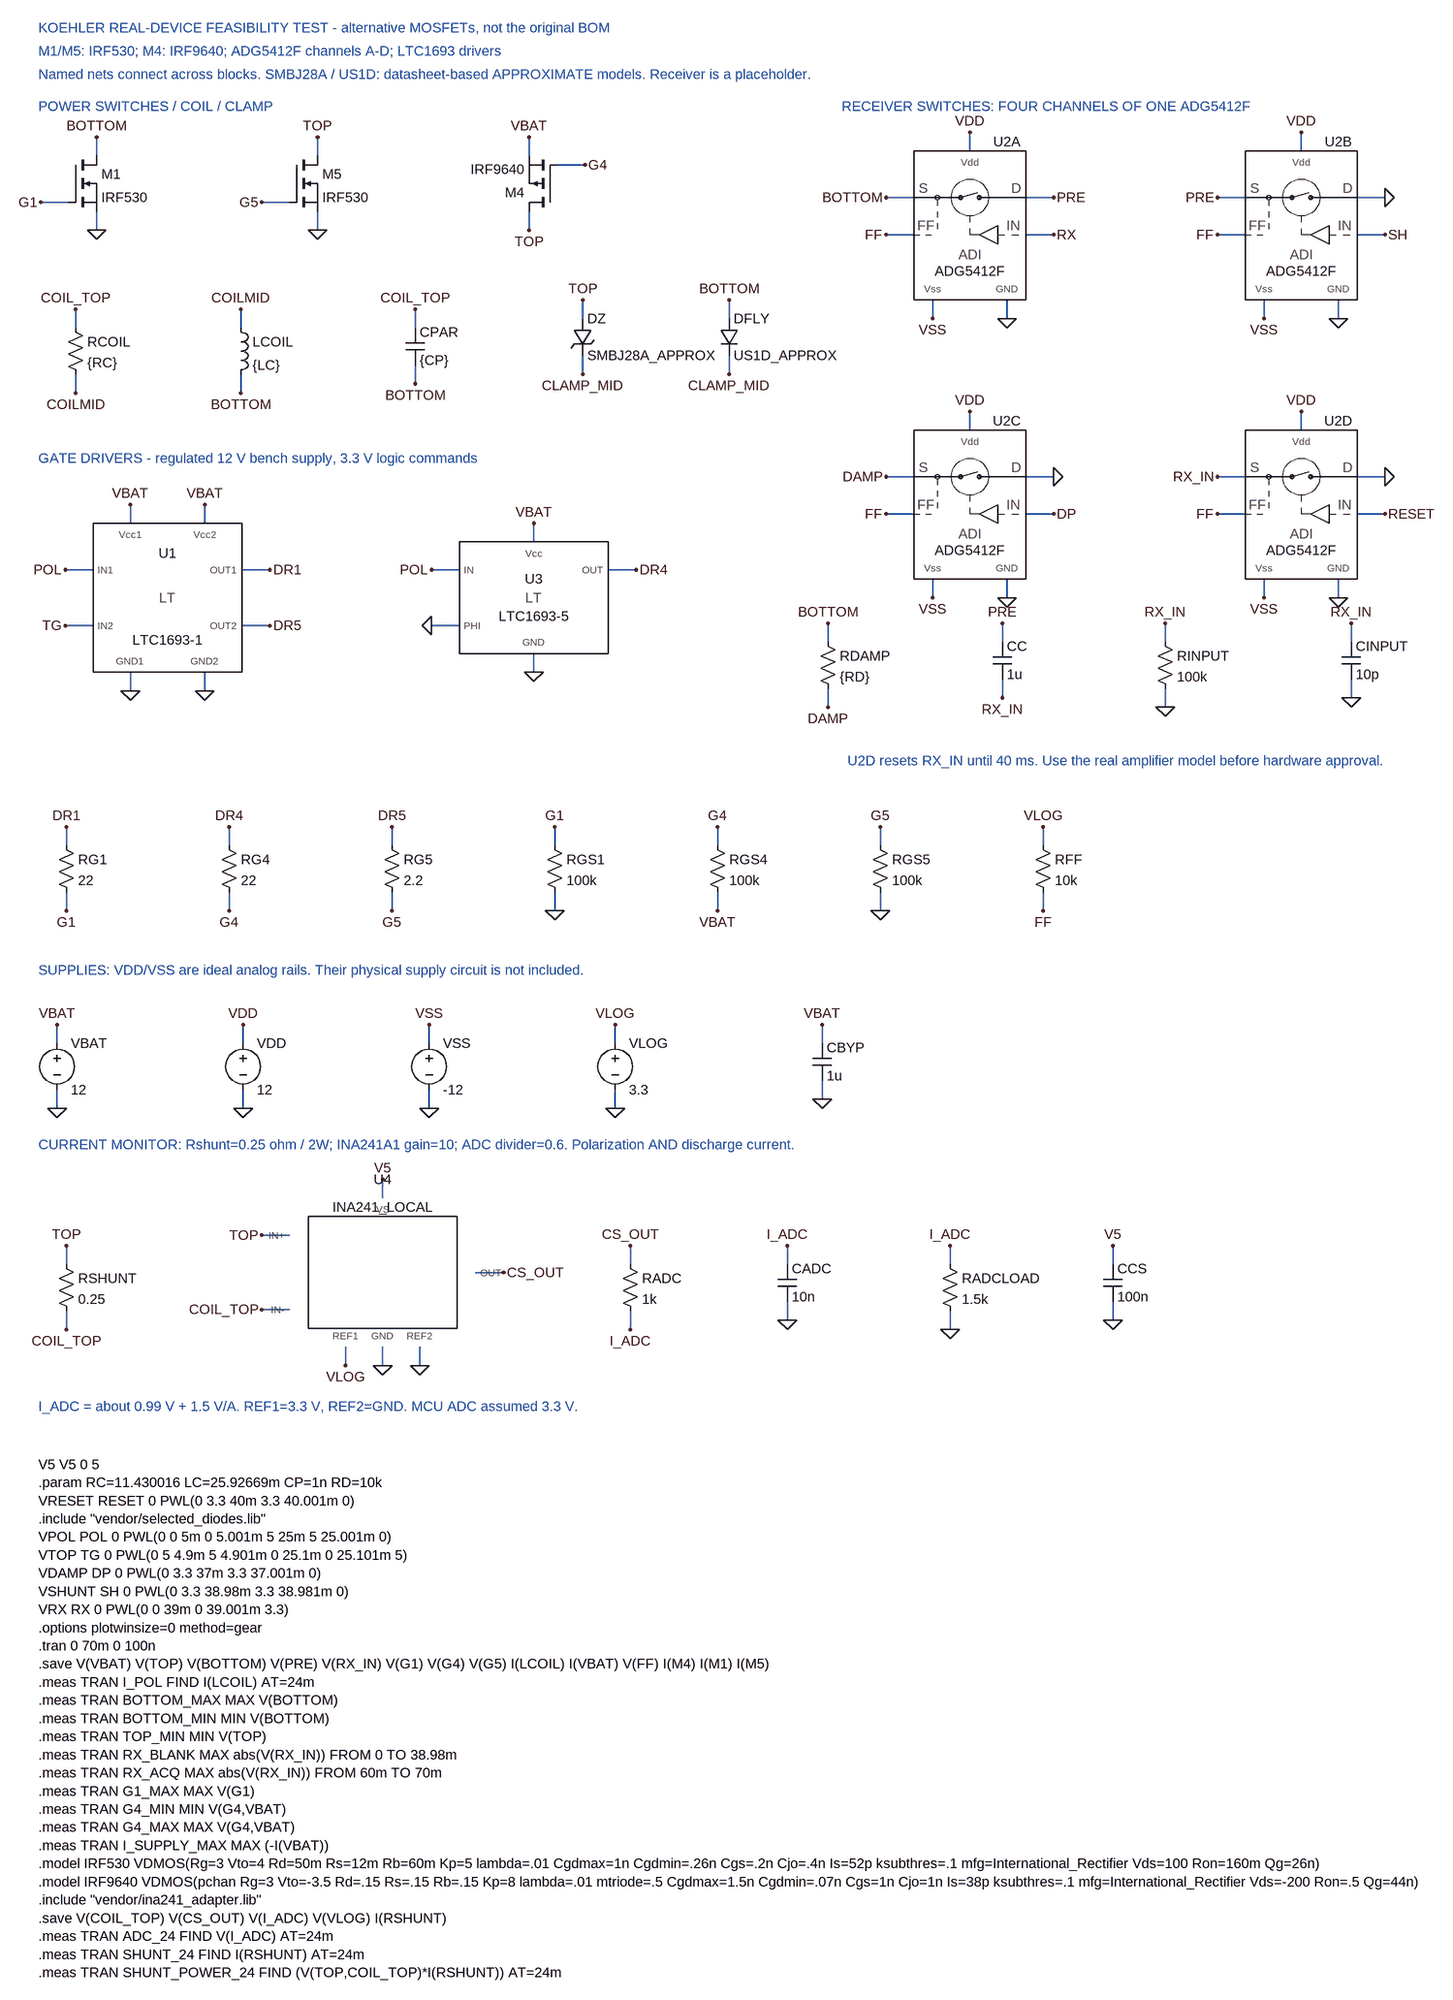
[diagram p0: schematic Koehler_AWG19_Newark_025R.asc]
Koehler_AWG19_Newark_025R.asc, the LTspice schematic file:
Version 4
SHEET 1 2800 2400
TEXT 48 0 Left 2 ;KOEHLER REAL-DEVICE FEASIBILITY TEST - alternative MOSFETs, not the original BOM
TEXT 48 40 Left 2 ;M1/M5: IRF530; M4: IRF9640; ADG5412F channels A-D; LTC1693 drivers
TEXT 48 80 Left 2 ;Named nets connect across blocks. SMBJ28A / US1D: datasheet-based APPROXIMATE models. Receiver is a placeholder.
TEXT 48 135 Left 2 ;POWER SWITCHES / COIL / CLAMP
SYMBOL nmos 100 220 R0
SYMATTR InstName M1
SYMATTR Value IRF530
WIRE 148 188 148 220
FLAG 148 188 BOTTOM
WIRE 52 300 100 300
FLAG 52 300 G1
WIRE 148 348 148 316
FLAG 148 348 0
SYMBOL nmos 480 220 R0
SYMATTR InstName M5
SYMATTR Value IRF530
WIRE 528 188 528 220
FLAG 528 188 TOP
WIRE 432 300 480 300
FLAG 432 300 G5
WIRE 528 348 528 316
FLAG 528 348 0
SYMBOL pmos 940 316 R180
SYMATTR InstName M4
SYMATTR Value IRF9640
WIRE 892 348 892 316
FLAG 892 348 TOP
WIRE 988 236 940 236
FLAG 988 236 G4
WIRE 892 188 892 220
FLAG 892 188 VBAT
SYMBOL res 96 500 R0
SYMATTR InstName RCOIL
SYMATTR Value {RC}
WIRE 112 484 112 516
FLAG 112 484 COIL_TOP
WIRE 112 628 112 596
FLAG 112 628 COILMID
SYMBOL ind 380 500 R0
SYMATTR InstName LCOIL
SYMATTR Value {LC}
WIRE 396 484 396 516
FLAG 396 484 COILMID
WIRE 396 628 396 596
FLAG 396 628 BOTTOM
SYMBOL cap 680 516 R0
SYMATTR InstName CPAR
SYMATTR Value {CP}
WIRE 696 484 696 516
FLAG 696 484 COIL_TOP
WIRE 696 612 696 580
FLAG 696 612 BOTTOM
SYMBOL zener 968 500 R0
SYMATTR InstName DZ
SYMATTR Value SMBJ28A_APPROX
WIRE 984 468 984 500
FLAG 984 468 TOP
WIRE 984 596 984 564
FLAG 984 596 CLAMP_MID
SYMBOL diode 1220 500 R0
SYMATTR InstName DFLY
SYMATTR Value US1D_APPROX
WIRE 1236 468 1236 500
FLAG 1236 468 BOTTOM
WIRE 1236 596 1236 564
FLAG 1236 596 CLAMP_MID
TEXT 1430 135 Left 2 ;RECEIVER SWITCHES: FOUR CHANNELS OF ONE ADG5412F
SYMBOL ADG5412F_local 1650 340 R0
SYMATTR InstName U2A
WIRE 1794 356 1746 356
FLAG 1794 356 RX
WIRE 1794 292 1746 292
FLAG 1794 292 PRE
WIRE 1506 292 1554 292
FLAG 1506 292 BOTTOM
WIRE 1586 500 1586 468
FLAG 1586 500 VSS
WIRE 1714 500 1714 468
FLAG 1714 500 0
WIRE 1650 180 1650 212
FLAG 1650 180 VDD
WIRE 1506 356 1554 356
FLAG 1506 356 FF
SYMBOL ADG5412F_local 2220 340 R0
SYMATTR InstName U2B
WIRE 2364 356 2316 356
FLAG 2364 356 SH
WIRE 2364 292 2316 292
FLAG 2364 292 0
WIRE 2076 292 2124 292
FLAG 2076 292 PRE
WIRE 2156 500 2156 468
FLAG 2156 500 VSS
WIRE 2284 500 2284 468
FLAG 2284 500 0
WIRE 2220 180 2220 212
FLAG 2220 180 VDD
WIRE 2076 356 2124 356
FLAG 2076 356 FF
SYMBOL ADG5412F_local 1650 820 R0
SYMATTR InstName U2C
WIRE 1794 836 1746 836
FLAG 1794 836 DP
WIRE 1794 772 1746 772
FLAG 1794 772 0
WIRE 1506 772 1554 772
FLAG 1506 772 DAMP
WIRE 1586 980 1586 948
FLAG 1586 980 VSS
WIRE 1714 980 1714 948
FLAG 1714 980 0
WIRE 1650 660 1650 692
FLAG 1650 660 VDD
WIRE 1506 836 1554 836
FLAG 1506 836 FF
SYMBOL ADG5412F_local 2220 820 R0
SYMATTR InstName U2D
WIRE 2364 836 2316 836
FLAG 2364 836 RESET
WIRE 2364 772 2316 772
FLAG 2364 772 0
WIRE 2076 772 2124 772
FLAG 2076 772 RX_IN
WIRE 2156 980 2156 948
FLAG 2156 980 VSS
WIRE 2284 980 2284 948
FLAG 2284 980 0
WIRE 2220 660 2220 692
FLAG 2220 660 VDD
WIRE 2076 836 2124 836
FLAG 2076 836 FF
SYMBOL res 1390 1040 R0
SYMATTR InstName RDAMP
SYMATTR Value {RD}
WIRE 1406 1024 1406 1056
FLAG 1406 1024 BOTTOM
WIRE 1406 1168 1406 1136
FLAG 1406 1168 DAMP
SYMBOL cap 1690 1056 R0
SYMATTR InstName CC
SYMATTR Value 1u
WIRE 1706 1024 1706 1056
FLAG 1706 1024 PRE
WIRE 1706 1152 1706 1120
FLAG 1706 1152 RX_IN
SYMBOL res 1970 1040 R0
SYMATTR InstName RINPUT
SYMATTR Value 100k
WIRE 1986 1024 1986 1056
FLAG 1986 1024 RX_IN
WIRE 1986 1168 1986 1136
FLAG 1986 1168 0
SYMBOL cap 2290 1056 R0
SYMATTR InstName CINPUT
SYMATTR Value 10p
WIRE 2306 1024 2306 1056
FLAG 2306 1024 RX_IN
WIRE 2306 1152 2306 1120
FLAG 2306 1152 0
TEXT 1440 1260 Left 2 ;U2D resets RX_IN until 40 ms. Use the real amplifier model before hardware approval.
TEXT 48 740 Left 2 ;GATE DRIVERS - regulated 12 V bench supply, 3.3 V logic commands
SYMBOL LTC1693-1_local 270 980 R0
SYMATTR InstName U1
WIRE 94 932 142 932
FLAG 94 932 POL
WIRE 206 1140 206 1108
FLAG 206 1140 0
WIRE 94 1028 142 1028
FLAG 94 1028 TG
WIRE 334 1140 334 1108
FLAG 334 1140 0
WIRE 446 1028 398 1028
FLAG 446 1028 DR5
WIRE 334 820 334 852
FLAG 334 820 VBAT
WIRE 446 932 398 932
FLAG 446 932 DR1
WIRE 206 820 206 852
FLAG 206 820 VBAT
SYMBOL LTC1693-5_local 900 980 R0
SYMATTR InstName U3
WIRE 724 932 772 932
FLAG 724 932 POL
WIRE 724 1028 772 1028
FLAG 724 1028 0
WIRE 900 1108 900 1076
FLAG 900 1108 0
WIRE 1076 932 1028 932
FLAG 1076 932 DR4
WIRE 900 852 900 884
FLAG 900 852 VBAT
SYMBOL res 80 1390 R0
SYMATTR InstName RG1
SYMATTR Value 22
WIRE 96 1374 96 1406
FLAG 96 1374 DR1
WIRE 96 1518 96 1486
FLAG 96 1518 G1
SYMBOL res 360 1390 R0
SYMATTR InstName RG4
SYMATTR Value 22
WIRE 376 1374 376 1406
FLAG 376 1374 DR4
WIRE 376 1518 376 1486
FLAG 376 1518 G4
SYMBOL res 640 1390 R0
SYMATTR InstName RG5
SYMATTR Value 2.2
WIRE 656 1374 656 1406
FLAG 656 1374 DR5
WIRE 656 1518 656 1486
FLAG 656 1518 G5
SYMBOL res 920 1390 R0
SYMATTR InstName RGS1
SYMATTR Value 100k
WIRE 936 1374 936 1406
FLAG 936 1374 G1
WIRE 936 1518 936 1486
FLAG 936 1518 0
SYMBOL res 1200 1390 R0
SYMATTR InstName RGS4
SYMATTR Value 100k
WIRE 1216 1374 1216 1406
FLAG 1216 1374 G4
WIRE 1216 1518 1216 1486
FLAG 1216 1518 VBAT
SYMBOL res 1480 1390 R0
SYMATTR InstName RGS5
SYMATTR Value 100k
WIRE 1496 1374 1496 1406
FLAG 1496 1374 G5
WIRE 1496 1518 1496 1486
FLAG 1496 1518 0
SYMBOL res 1760 1390 R0
SYMATTR InstName RFF
SYMATTR Value 10k
WIRE 1776 1374 1776 1406
FLAG 1776 1374 VLOG
WIRE 1776 1518 1776 1486
FLAG 1776 1518 FF
SYMBOL voltage 80 1730 R0
SYMATTR InstName VBAT
SYMATTR Value 12
WIRE 80 1714 80 1746
FLAG 80 1714 VBAT
WIRE 80 1858 80 1826
FLAG 80 1858 0
SYMBOL voltage 400 1730 R0
SYMATTR InstName VDD
SYMATTR Value 12
WIRE 400 1714 400 1746
FLAG 400 1714 VDD
WIRE 400 1858 400 1826
FLAG 400 1858 0
SYMBOL voltage 720 1730 R0
SYMATTR InstName VSS
SYMATTR Value -12
WIRE 720 1714 720 1746
FLAG 720 1714 VSS
WIRE 720 1858 720 1826
FLAG 720 1858 0
SYMBOL voltage 1040 1730 R0
SYMATTR InstName VLOG
SYMATTR Value 3.3
WIRE 1040 1714 1040 1746
FLAG 1040 1714 VLOG
WIRE 1040 1858 1040 1826
FLAG 1040 1858 0
SYMBOL cap 1380 1746 R0
SYMATTR InstName CBYP
SYMATTR Value 1u
WIRE 1396 1714 1396 1746
FLAG 1396 1714 VBAT
WIRE 1396 1842 1396 1810
FLAG 1396 1842 0
TEXT 48 1620 Left 2 ;SUPPLIES: VDD/VSS are ideal analog rails. Their physical supply circuit is not included.
TEXT 48 1920 Left 2 ;CURRENT MONITOR: Rshunt=0.25 ohm / 2W; INA241A1 gain=10; ADC divider=0.6. Polarization AND discharge current.
SYMBOL res 80 2110 R0
SYMATTR InstName RSHUNT
SYMATTR Value 0.25
WIRE 96 2094 96 2126
FLAG 96 2094 TOP
WIRE 96 2238 96 2206
FLAG 96 2238 COIL_TOP
SYMBOL INA241_local 640 2140 R0
SYMATTR InstName U4
WIRE 848 2140 800 2140
FLAG 848 2140 CS_OUT
WIRE 432 2076 480 2076
FLAG 432 2076 TOP
WIRE 432 2204 480 2204
FLAG 432 2204 COIL_TOP
WIRE 576 2300 576 2268
FLAG 576 2300 VLOG
WIRE 704 2300 704 2268
FLAG 704 2300 0
WIRE 640 1980 640 2012
FLAG 640 1980 V5
WIRE 640 2300 640 2268
FLAG 640 2300 0
SYMBOL res 1050 2110 R0
SYMATTR InstName RADC
SYMATTR Value 1k
WIRE 1066 2094 1066 2126
FLAG 1066 2094 CS_OUT
WIRE 1066 2238 1066 2206
FLAG 1066 2238 I_ADC
SYMBOL cap 1320 2126 R0
SYMATTR InstName CADC
SYMATTR Value 10n
WIRE 1336 2094 1336 2126
FLAG 1336 2094 I_ADC
WIRE 1336 2222 1336 2190
FLAG 1336 2222 0
SYMBOL res 1600 2110 R0
SYMATTR InstName RADCLOAD
SYMATTR Value 1.5k
WIRE 1616 2094 1616 2126
FLAG 1616 2094 I_ADC
WIRE 1616 2238 1616 2206
FLAG 1616 2238 0
SYMBOL cap 1880 2126 R0
SYMATTR InstName CCS
SYMATTR Value 100n
WIRE 1896 2094 1896 2126
FLAG 1896 2094 V5
WIRE 1896 2222 1896 2190
FLAG 1896 2222 0
TEXT 48 2370 Left 2 ;I_ADC = about 0.99 V + 1.5 V/A. REF1=3.3 V, REF2=GND. MCU ADC assumed 3.3 V.
TEXT 48 2470 Left 2 !V5 V5 0 5\n.param RC=11.430016 LC=25.92669m CP=1n RD=10k\nVRESET RESET 0 PWL(0 3.3 40m 3.3 40.001m 0)\n.include "vendor/selected_diodes.lib"\nVPOL POL 0 PWL(0 0 5m 0 5.001m 5 25m 5 25.001m 0)\nVTOP TG 0 PWL(0 5 4.9m 5 4.901m 0 25.1m 0 25.101m 5)\nVDAMP DP 0 PWL(0 3.3 37m 3.3 37.001m 0)\nVSHUNT SH 0 PWL(0 3.3 38.98m 3.3 38.981m 0)\nVRX RX 0 PWL(0 0 39m 0 39.001m 3.3)\n.options plotwinsize=0 method=gear\n.tran 0 70m 0 100n\n.save V(VBAT) V(TOP) V(BOTTOM) V(PRE) V(RX_IN) V(G1) V(G4) V(G5) I(LCOIL) I(VBAT) V(FF) I(M4) I(M1) I(M5)\n.meas TRAN I_POL FIND I(LCOIL) AT=24m\n.meas TRAN BOTTOM_MAX MAX V(BOTTOM)\n.meas TRAN BOTTOM_MIN MIN V(BOTTOM)\n.meas TRAN TOP_MIN MIN V(TOP)\n.meas TRAN RX_BLANK MAX abs(V(RX_IN)) FROM 0 TO 38.98m\n.meas TRAN RX_ACQ MAX abs(V(RX_IN)) FROM 60m TO 70m\n.meas TRAN G1_MAX MAX V(G1)\n.meas TRAN G4_MIN MIN V(G4,VBAT)\n.meas TRAN G4_MAX MAX V(G4,VBAT)\n.meas TRAN I_SUPPLY_MAX MAX (-I(VBAT))\n.model IRF530 VDMOS(Rg=3 Vto=4 Rd=50m Rs=12m Rb=60m Kp=5 lambda=.01 Cgdmax=1n Cgdmin=.26n Cgs=.2n Cjo=.4n Is=52p ksubthres=.1 mfg=International_Rectifier Vds=100 Ron=160m Qg=26n)\n.model IRF9640 VDMOS(pchan Rg=3 Vto=-3.5 Rd=.15 Rs=.15 Rb=.15 Kp=8 lambda=.01 mtriode=.5 Cgdmax=1.5n Cgdmin=.07n Cgs=1n Cjo=1n Is=38p ksubthres=.1 mfg=International_Rectifier Vds=-200 Ron=.5 Qg=44n)\n.include "vendor/ina241_adapter.lib"\n.save V(COIL_TOP) V(CS_OUT) V(I_ADC) V(VLOG) I(RSHUNT)\n.meas TRAN ADC_24 FIND V(I_ADC) AT=24m\n.meas TRAN SHUNT_24 FIND I(RSHUNT) AT=24m\n.meas TRAN SHUNT_POWER_24 FIND (V(TOP,COIL_TOP)*I(RSHUNT)) AT=24m

The netlist it stands for:
* Koehler_AWG19_Newark_025R.asc
M1 BOTTOM G1 0 0 IRF530
M5 TOP G5 0 0 IRF530
M4 TOP G4 VBAT VBAT IRF9640
RCOIL COIL_TOP COILMID {RC}
LCOIL COILMID BOTTOM {LC}
CPAR COIL_TOP BOTTOM {CP}
DZ TOP CLAMP_MID SMBJ28A_APPROX
DFLY BOTTOM CLAMP_MID US1D_APPROX
XU2A RX PRE BOTTOM VSS 0 VDD FF ADG5412F  ; pins IN D S Vss GND Vdd FF
XU2B SH 0 PRE VSS 0 VDD FF ADG5412F  ; pins IN D S Vss GND Vdd FF
XU2C DP 0 DAMP VSS 0 VDD FF ADG5412F  ; pins IN D S Vss GND Vdd FF
XU2D RESET 0 RX_IN VSS 0 VDD FF ADG5412F  ; pins IN D S Vss GND Vdd FF
RDAMP BOTTOM DAMP {RD}
CC PRE RX_IN 1u
RINPUT RX_IN 0 100k
CINPUT RX_IN 0 10p
XU1 POL 0 TG 0 DR5 VBAT DR1 VBAT LTC1693-1  ; pins IN1 GND1 IN2 GND2 OUT2 Vcc2 OUT1 Vcc1
XU3 POL 0 0 DR4 VBAT LTC1693-5  ; pins IN PHI GND OUT Vcc
RG1 DR1 G1 22
RG4 DR4 G4 22
RG5 DR5 G5 2.2
RGS1 G1 0 100k
RGS4 G4 VBAT 100k
RGS5 G5 0 100k
RFF VLOG FF 10k
VBAT VBAT 0 12
VDD VDD 0 12
VSS VSS 0 -12
VLOG VLOG 0 3.3
CBYP VBAT 0 1u
RSHUNT TOP COIL_TOP 0.25
XU4 CS_OUT TOP COIL_TOP VLOG 0 V5 0 INA241_LOCAL  ; pins OUT IN+ IN- REF1 REF2 VS GND
RADC CS_OUT I_ADC 1k
CADC I_ADC 0 10n
RADCLOAD I_ADC 0 1.5k
CCS V5 0 100n
.model D D
.lib standard.dio
.model NMOS NMOS
.model PMOS PMOS
.lib standard.mos
* KOEHLER REAL-DEVICE FEASIBILITY TEST - alternative MOSFETs, not the original BOM
* M1/M5: IRF530; M4: IRF9640; ADG5412F channels A-D; LTC1693 drivers
* Named nets connect across blocks. SMBJ28A / US1D: datasheet-based APPROXIMATE models. Receiver is a placeholder.
* POWER SWITCHES / COIL / CLAMP
* RECEIVER SWITCHES: FOUR CHANNELS OF ONE ADG5412F
* U2D resets RX_IN until 40 ms. Use the real amplifier model before hardware approval.
* GATE DRIVERS - regulated 12 V bench supply, 3.3 V logic commands
* SUPPLIES: VDD/VSS are ideal analog rails. Their physical supply circuit is not included.
* CURRENT MONITOR: Rshunt=0.25 ohm / 2W; INA241A1 gain=10; ADC divider=0.6. Polarization AND discharge current.
* I_ADC = about 0.99 V + 1.5 V/A. REF1=3.3 V, REF2=GND. MCU ADC assumed 3.3 V.
V5 V5 0 5
.param RC=11.430016 LC=25.92669m CP=1n RD=10k
VRESET RESET 0 PWL(0 3.3 40m 3.3 40.001m 0)
.include "vendor/selected_diodes.lib"
VPOL POL 0 PWL(0 0 5m 0 5.001m 5 25m 5 25.001m 0)
VTOP TG 0 PWL(0 5 4.9m 5 4.901m 0 25.1m 0 25.101m 5)
VDAMP DP 0 PWL(0 3.3 37m 3.3 37.001m 0)
VSHUNT SH 0 PWL(0 3.3 38.98m 3.3 38.981m 0)
VRX RX 0 PWL(0 0 39m 0 39.001m 3.3)
.options plotwinsize=0 method=gear
.tran 0 70m 0 100n
.save V(VBAT) V(TOP) V(BOTTOM) V(PRE) V(RX_IN) V(G1) V(G4) V(G5) I(LCOIL) I(VBAT) V(FF) I(M4) I(M1) I(M5)
.meas TRAN I_POL FIND I(LCOIL) AT=24m
.meas TRAN BOTTOM_MAX MAX V(BOTTOM)
.meas TRAN BOTTOM_MIN MIN V(BOTTOM)
.meas TRAN TOP_MIN MIN V(TOP)
.meas TRAN RX_BLANK MAX abs(V(RX_IN)) FROM 0 TO 38.98m
.meas TRAN RX_ACQ MAX abs(V(RX_IN)) FROM 60m TO 70m
.meas TRAN G1_MAX MAX V(G1)
.meas TRAN G4_MIN MIN V(G4,VBAT)
.meas TRAN G4_MAX MAX V(G4,VBAT)
.meas TRAN I_SUPPLY_MAX MAX (-I(VBAT))
.model IRF530 VDMOS(Rg=3 Vto=4 Rd=50m Rs=12m Rb=60m Kp=5 lambda=.01 Cgdmax=1n Cgdmin=.26n Cgs=.2n Cjo=.4n Is=52p ksubthres=.1 mfg=International_Rectifier Vds=100 Ron=160m Qg=26n)
.model IRF9640 VDMOS(pchan Rg=3 Vto=-3.5 Rd=.15 Rs=.15 Rb=.15 Kp=8 lambda=.01 mtriode=.5 Cgdmax=1.5n Cgdmin=.07n Cgs=1n Cjo=1n Is=38p ksubthres=.1 mfg=International_Rectifier Vds=-200 Ron=.5 Qg=44n)
.include "vendor/ina241_adapter.lib"
.save V(COIL_TOP) V(CS_OUT) V(I_ADC) V(VLOG) I(RSHUNT)
.meas TRAN ADC_24 FIND V(I_ADC) AT=24m
.meas TRAN SHUNT_24 FIND I(RSHUNT) AT=24m
.meas TRAN SHUNT_POWER_24 FIND (V(TOP,COIL_TOP)*I(RSHUNT)) AT=24m
.lib vendor/ADG5412F.sub
.lib vendor/LTC1693-1.sub
.lib vendor/LTC1693-5.sub
.backanno
.end